# Altium schematic sheet LED_US_1.SchDoc: LED_US_1
size A3
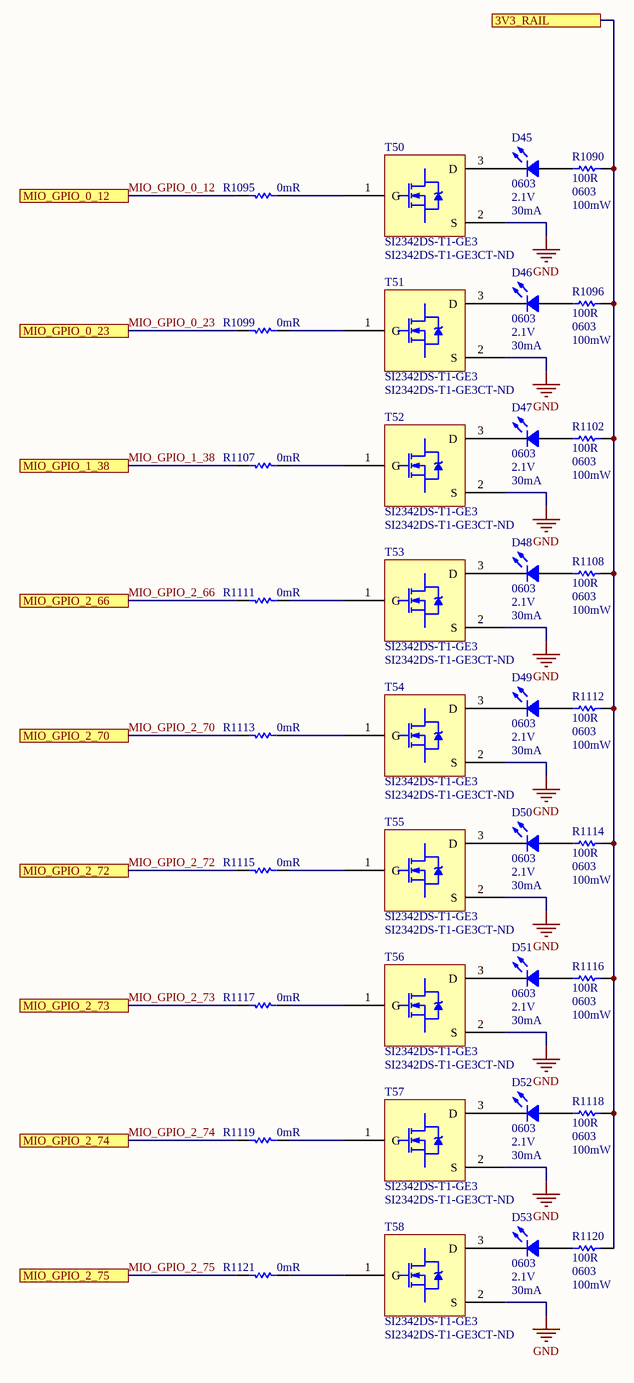
[diagram p0: LED_US_1.SchDoc]

## Parts
D45  Case Code (Imperial): 0603  Forward Voltage: 2.1V  Forward Current: 30mA  [LED 0603/1608 GREEN]  (hidden comment: LTST-C190GKT)
D46  Case Code (Imperial): 0603  Forward Voltage: 2.1V  Forward Current: 30mA  [LED 0603/1608 GREEN]  (hidden comment: LTST-C190GKT)
D47  Case Code (Imperial): 0603  Forward Voltage: 2.1V  Forward Current: 30mA  [LED 0603/1608 GREEN]  (hidden comment: LTST-C190GKT)
D48  Case Code (Imperial): 0603  Forward Voltage: 2.1V  Forward Current: 30mA  [LED 0603/1608 GREEN]  (hidden comment: LTST-C190GKT)
D49  Case Code (Imperial): 0603  Forward Voltage: 2.1V  Forward Current: 30mA  [LED 0603/1608 GREEN]  (hidden comment: LTST-C190GKT)
D50  Case Code (Imperial): 0603  Forward Voltage: 2.1V  Forward Current: 30mA  [LED 0603/1608 GREEN]  (hidden comment: LTST-C190GKT)
D51  Case Code (Imperial): 0603  Forward Voltage: 2.1V  Forward Current: 30mA  [LED 0603/1608 GREEN]  (hidden comment: LTST-C190GKT)
D52  Case Code (Imperial): 0603  Forward Voltage: 2.1V  Forward Current: 30mA  [LED 0603/1608 GREEN]  (hidden comment: LTST-C190GKT)
D53  Case Code (Imperial): 0603  Forward Voltage: 2.1V  Forward Current: 30mA  [LED 0603/1608 GREEN]  (hidden comment: LTST-C190GKT)
R1090  100R  Case/Package: 0603  Power Rating: 100mW  [RES 0603/1608 RF]
R1095  0mR  [RES 0402/1005 RF KK]
R1096  100R  Case/Package: 0603  Power Rating: 100mW  [RES 0603/1608 RF]
R1099  0mR  [RES 0402/1005 RF KK]
R1102  100R  Case/Package: 0603  Power Rating: 100mW  [RES 0603/1608 RF]
R1107  0mR  [RES 0402/1005 RF KK]
R1108  100R  Case/Package: 0603  Power Rating: 100mW  [RES 0603/1608 RF]
R1111  0mR  [RES 0402/1005 RF KK]
R1112  100R  Case/Package: 0603  Power Rating: 100mW  [RES 0603/1608 RF]
R1113  0mR  [RES 0402/1005 RF KK]
R1114  100R  Case/Package: 0603  Power Rating: 100mW  [RES 0603/1608 RF]
R1115  0mR  [RES 0402/1005 RF KK]
R1116  100R  Case/Package: 0603  Power Rating: 100mW  [RES 0603/1608 RF]
R1117  0mR  [RES 0402/1005 RF KK]
R1118  100R  Case/Package: 0603  Power Rating: 100mW  [RES 0603/1608 RF]
R1119  0mR  [RES 0402/1005 RF KK]
R1120  100R  Case/Package: 0603  Power Rating: 100mW  [RES 0603/1608 RF]
R1121  0mR  [RES 0402/1005 RF KK]
T50  SI2342DS-T1-GE3  Supplier Part Number 1: SI2342DS-T1-GE3CT-ND  [SI2342DS-T1-GE3]
T51  SI2342DS-T1-GE3  Supplier Part Number 1: SI2342DS-T1-GE3CT-ND  [SI2342DS-T1-GE3]
T52  SI2342DS-T1-GE3  Supplier Part Number 1: SI2342DS-T1-GE3CT-ND  [SI2342DS-T1-GE3]
T53  SI2342DS-T1-GE3  Supplier Part Number 1: SI2342DS-T1-GE3CT-ND  [SI2342DS-T1-GE3]
T54  SI2342DS-T1-GE3  Supplier Part Number 1: SI2342DS-T1-GE3CT-ND  [SI2342DS-T1-GE3]
T55  SI2342DS-T1-GE3  Supplier Part Number 1: SI2342DS-T1-GE3CT-ND  [SI2342DS-T1-GE3]
T56  SI2342DS-T1-GE3  Supplier Part Number 1: SI2342DS-T1-GE3CT-ND  [SI2342DS-T1-GE3]
T57  SI2342DS-T1-GE3  Supplier Part Number 1: SI2342DS-T1-GE3CT-ND  [SI2342DS-T1-GE3]
T58  SI2342DS-T1-GE3  Supplier Part Number 1: SI2342DS-T1-GE3CT-ND  [SI2342DS-T1-GE3]

## Ports
3V3_RAIL, MIO_GPIO_0_12, MIO_GPIO_0_23, MIO_GPIO_1_38, MIO_GPIO_2_66, MIO_GPIO_2_70, MIO_GPIO_2_72, MIO_GPIO_2_73, MIO_GPIO_2_74, MIO_GPIO_2_75

## Nets
GND: T50.2(S) T51.2(S) T52.2(S) T53.2(S) T54.2(S) T55.2(S) T56.2(S) T57.2(S) T58.2(S)
3V3_RAIL: R1090.2 R1096.2 R1102.2 R1108.2 R1112.2 R1114.2 R1116.2 R1118.2 R1120.2 ; port 3V3_RAIL
MIO_GPIO_0_12: R1095.2 ; port MIO_GPIO_0_12
MIO_GPIO_0_23: R1099.2 ; port MIO_GPIO_0_23
MIO_GPIO_1_38: R1107.2 ; port MIO_GPIO_1_38
MIO_GPIO_2_66: R1111.2 ; port MIO_GPIO_2_66
MIO_GPIO_2_70: R1113.2 ; port MIO_GPIO_2_70
MIO_GPIO_2_72: R1115.2 ; port MIO_GPIO_2_72
MIO_GPIO_2_73: R1117.2 ; port MIO_GPIO_2_73
MIO_GPIO_2_74: R1119.2 ; port MIO_GPIO_2_74
MIO_GPIO_2_75: R1121.2 ; port MIO_GPIO_2_75
NetD45_1: D45.1 R1090.1
NetD45_2: D45.2 T50.3(D)
NetD46_1: D46.1 R1096.1
NetD46_2: D46.2 T51.3(D)
NetD47_1: D47.1 R1102.1
NetD47_2: D47.2 T52.3(D)
NetD48_1: D48.1 R1108.1
NetD48_2: D48.2 T53.3(D)
NetD49_1: D49.1 R1112.1
NetD49_2: D49.2 T54.3(D)
NetD50_1: D50.1 R1114.1
NetD50_2: D50.2 T55.3(D)
NetD51_1: D51.1 R1116.1
NetD51_2: D51.2 T56.3(D)
NetD52_1: D52.1 R1118.1
NetD52_2: D52.2 T57.3(D)
NetD53_1: D53.1 R1120.1
NetD53_2: D53.2 T58.3(D)
NetR1095_1: R1095.1 T50.1(G)
NetR1099_1: R1099.1 T51.1(G)
NetR1107_1: R1107.1 T52.1(G)
NetR1111_1: R1111.1 T53.1(G)
NetR1113_1: R1113.1 T54.1(G)
NetR1115_1: R1115.1 T55.1(G)
NetR1117_1: R1117.1 T56.1(G)
NetR1119_1: R1119.1 T57.1(G)
NetR1121_1: R1121.1 T58.1(G)

## Library data of the parts
D45-D53 = LTST-C190GKT: LED,  LTST-C190GKT; Manufacturer 1: Vishay Lite-On; Color: Green; Lens Color: Colorless; Luminous Intensity: 6mcd; Viewing Angle: 130°; Lens Style: Clear,Diffused,Colorless,Rectangular; Power Rating: 100mW; Dominant Wavelength: 569nm; Test Current: 10mA; Lens Transparency: Clear; Number of Elements: 1; Wavelength: 565nm; Voltage: 2V; Reverse Voltage: 5V; Supplier 1: Digi-Key; Manufacturer Part Number 1: LTST-C190GKT; Stock 1: 908158; Pricing 1: 1=0.26000, 10=0.18800, 100=0.08880, 500=0.05922, 1000=0.04639 (USD); RoHS: Yes; Mount: Surface Mount; Case/Package: 0603; Number of Pins: 2; Case Code (Metric): 1608; Min Operating Temperature: -55°C; Max Operating Temperature: 85°C; Package Quantity: 1; Packaging: Tape and Reel; Illumination Color: Green; Power Dissipation: 100mW; Number of LEDs: 1; Length: 1.6mm; Height: 0.8mm; Width: 0.8mm; Depth: 0.8mm; Radiation Hardening: No; Lead Free: Lead Free; ComponentLink1URL: https://datasheet.ciiva.com/11775/0900766b80dc02a6-11775616.pdf?src-supplier=RSComponents; ComponentLink1Description: https://datasheet.ciiva.com/11775/0900766b80dc02a6-11775616.pdf?src-supplier=RSComponents; ComponentLink2URL: https://datasheet.ciiva.com/2109/ltst-c190gkt-2109985.pdf?src-supplier=Digi-Key; ComponentLink2Description: https://datasheet.ciiva.com/2109/ltst-c190gkt-2109985.pdf?src-supplier=Digi-Key; ComponentLink3URL: https://datasheet.ciiva.com/16392/lite-on20ltst-c190gkt-16392818.pdf?src-supplier=Future+Electronics; ComponentLink3Description: https://datasheet.ciiva.com/16392/lite-on20ltst-c190gkt-16392818.pdf?src-supplier=Future+Electronics; ComponentLink4URL: https://datasheet.ciiva.com/12403/lite-on-ltst-c190gkt-187204-12403884.pdf?src-supplier=Mouser; ComponentLink4Description: https://datasheet.ciiva.com/12403/lite-on-ltst-c190gkt-187204-12403884.pdf?src-supplier=Mouser; ComponentLink5URL: https://datasheet.ciiva.com/2109/ltst-c190gkt-2109986.pdf?src-supplier=Digi-Key; ComponentLink5Description: https://datasheet.ciiva.com/2109/ltst-c190gkt-2109986.pdf?src-supplier=Digi-Key; ComponentLink6URL: https://datasheet.ciiva.com/2109/ltst-c190gkt-2109987.pdf?src-supplier=Digi-Key; ComponentLink6Description: https://datasheet.ciiva.com/2109/ltst-c190gkt-2109987.pdf?src-supplier=Digi-Key; Supplier Part Number 1: 160-1183-1-ND
R1090 R1096 R1102 R1108 R1112 R1114 R1116 R1118 R1120 = Resistor: KOA SPEAR ELECTRONICS - RK73H1JTTD1000F - RES, 100R, 1%, 0.1W, 0603, THICK FILM; Manufacturer: KOA Speer; Voltage Rating: 50V; Temperature Coefficient: 100ppm/°C; Supplier 1: Digi-Key; Supplier Part Number 1: 2019-RK73H1JTTD1000FCT-ND; Manufacturer Part Number: RK73H1JTTD1000F; RoHS: Yes; Category: Chip SMD Resistors; Stock 1: 1297624; Pricing 1: 1=0,10000, 10=0,02200, 100=0,00910, 1000=0,00408, 2500=0,00354 (USD); Number of Pins: 2; Case Code (Imperial): 0603; Case Code (Metric): 1608; Min Operating Temperature: -55°C; Max Operating Temperature: 155°C; Resistance: 100R; Tolerance: 1%; Packaging: Tape and Reel; Package Quantity: 5000; Composition: Thick Film; Termination: SMD/SMT; Military Standard: Not; Voltage Rating (DC): 50V; Length: 1.6mm; Height: 0.45mm; Width: 0.8mm; Depth: 0.8mm; REACH SVHC: Unknown; Lead Free: Lead Free; ComponentLink1URL: https://datasheet.ciiva.com/48426/rk73h-series-eng-jap-tds-48426518.pdf?src-supplier=Distrelec; ComponentLink1Description: https://datasheet.ciiva.com/48426/rk73h-series-eng-jap-tds-48426518.pdf?src-supplier=Distrelec; ComponentLink2URL: https://datasheet.ciiva.com/7773/549017-7773367.pdf?src-supplier=Element14; ComponentLink2Description: https://datasheet.ciiva.com/7773/549017-7773367.pdf?src-supplier=Element14; ComponentLink3URL: https://datasheet.ciiva.com/5556/rk73h-5556218.pdf?src-supplier=Mouser; ComponentLink3Description: https://datasheet.ciiva.com/5556/rk73h-5556218.pdf?src-supplier=Mouser
R1095 R1099 R1107 R1111 R1113 R1115 R1117 R1119 R1121 = Resistor: Manufacturer 1: Yageo; Manufacturer Part Number 1: RC0402JR-070RL; Power Rating: 62.5mW; Tolerance: 5%; Voltage Rating: 50V; Max Power Dissipation: 63mW; Temperature Coefficient: 200ppm/°C; Supplier 1: Digi-Key; Supplier Part Number 1: 311-0.0JRCT-ND; Stock 1: 69822252; Pricing 1: 1=0.10000, 10=0.01200, 25=0.00920, 50=0.00680, 100=0.00510, 250=0.00388, 500=0.00308, 1000=0.00227, 5000=0.00163 (USD); RoHS: Yes; Case/Package: 0402; Contact Plating: Tin,Matte; Case Code (Metric): 1005; Case Code (Imperial): 0402; Min Operating Temperature: -55°C; Max Operating Temperature: 155°C; Resistance: 0mR; Packaging: Tape and Reel; Composition: Thick Film; Package Quantity: 1; Number of Terminations: 2; Termination: SMD/SMT; Military Standard: Not; Features: Moisture Resistant; Length: 1mm; Height: 0.016inch; Width: 0.02inch; Depth: 0.5mm; Radiation Hardening: No; REACH SVHC: Unknown; Lead Free: Lead Free; ComponentLink1URL: https://datasheet.ciiva.com/2452/pyu-rc0402-51-rohs-l-6-2452608.pdf?src-supplier=Digi-Key; ComponentLink1Description: https://datasheet.ciiva.com/2452/pyu-rc0402-51-rohs-l-6-2452608.pdf?src-supplier=Digi-Key; ComponentLink2URL: https://datasheet.ciiva.com/11808/0900766b80c66297-11808195.pdf?src-supplier=RSComponents; ComponentLink2Description: https://datasheet.ciiva.com/11808/0900766b80c66297-11808195.pdf?src-supplier=RSComponents; ComponentLink3URL: https://datasheet.ciiva.com/2452/pyu-r-int-thick-7-2452609.pdf?src-supplier=Digi-Key; ComponentLink3Description: https://datasheet.ciiva.com/2452/pyu-r-int-thick-7-2452609.pdf?src-supplier=Digi-Key; ComponentLink4URL: https://datasheet.ciiva.com/22747/1018594-22747515.pdf?src-supplier=Element14; ComponentLink4Description: https://datasheet.ciiva.com/22747/1018594-22747515.pdf?src-supplier=Element14; ComponentLink5URL: https://datasheet.ciiva.com/7983/1018594-7983535.pdf?src-supplier=Element14; ComponentLink5Description: https://datasheet.ciiva.com/7983/1018594-7983535.pdf?src-supplier=Element14; ComponentLink6URL: https://datasheet.ciiva.com/2452/pyu-r-int-thick-7-2452610.pdf?src-supplier=Digi-Key; ComponentLink6Description: https://datasheet.ciiva.com/2452/pyu-r-int-thick-7-2452610.pdf?src-supplier=Digi-Key; ComponentLink7URL: https://datasheet.ciiva.com/8896/pyu-rc0402-51-rohs-l-6-8896201.pdf?src-supplier=Avnet; ComponentLink7Description: https://datasheet.ciiva.com/8896/pyu-rc0402-51-rohs-l-6-8896201.pdf?src-supplier=Avnet; ComponentLink8URL: https://datasheet.ciiva.com/28386/pyu-rc0402-51-rohs-l-6-28386633.pdf?src-supplier=Avnet+Europe; ComponentLink8Description: https://datasheet.ciiva.com/28386/pyu-rc0402-51-rohs-l-6-28386633.pdf?src-supplier=Avnet+Europe; ComponentLink9URL: https://datasheet.ciiva.com/15189/getdatasheetpartid-326379-15189533.pdf?src-supplier=Verical; ComponentLink9Description: https://datasheet.ciiva.com/15189/getdatasheetpartid-326379-15189533.pdf?src-supplier=Verical
T50-T58 = SI2342DS-T1-GE3: Trans MOSFET N-CH 8V 6A 3-Pin SOT-23 T/R; Manufacturer: Vishay; Rds On Max: 17mR; Input Capacitance: 1.07nF; Rise Time: 14ns; Max Power Dissipation: 2.5W; Number of Elements: 1; Power Dissipation: 1.3W; Turn-On Delay Time: 6ns; Turn-Off Delay Time: 65ns; Fall Time: 25ns; Threshold Voltage: 800mV; Gate to Source Voltage (Vgs): 5V; Supplier 1: Digi-Key; Manufacturer Part Number: SI2342DS-T1-GE3; RoHS: Yes; Category: MOSFETs; Stock 1: 25972; Pricing 1: 1=0,50000, 10=0,42500, 25=0,39640, 100=0,29460, 250=0,27984, 500=0,23000, 1000=0,18695 (USD); Mount: Surface Mount; Case/Package: SOT-23; Number of Pins: 3; Contact Plating: Tin,Matte; Min Operating Temperature: -55°C; Max Operating Temperature: 150°C; Packaging: Tape and Reel; Package Quantity: 3000; Drain to Source Voltage (Vdss): 8V; Continuous Drain Current (ID): 6A; Radiation Hardening: No; REACH SVHC: No SVHC; Lead Free: Lead Free; ComponentLink1URL: https://datasheet.ciiva.com/14905/si2342ds-14905257.pdf?src-supplier=Arrow; ComponentLink1Description: https://datasheet.ciiva.com/14905/si2342ds-14905257.pdf?src-supplier=Arrow; ComponentLink2URL: https://datasheet.ciiva.com/29746/si2342ds-29746581.pdf?src-supplier=Digi-Key; ComponentLink2Description: https://datasheet.ciiva.com/29746/si2342ds-29746581.pdf?src-supplier=Digi-Key; ComponentLink3URL: https://datasheet.ciiva.com/30021/si2342ds-30021814.pdf?src-supplier=Avnet; ComponentLink3Description: https://datasheet.ciiva.com/30021/si2342ds-30021814.pdf?src-supplier=Avnet